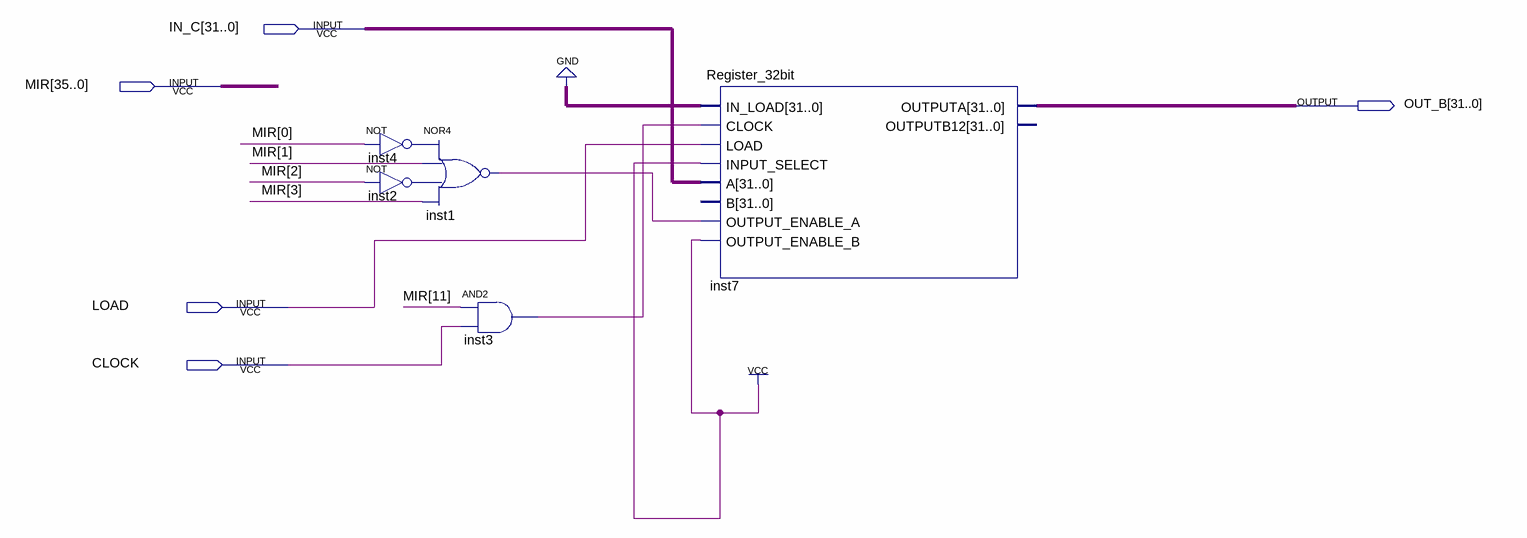
[diagram p0: schematic sheet]
// Quartus schematic LV.bdf as structural Verilog: 5 symbols, 5 pins
module LV (
  input  [31:0] IN_C,
  input  [35:0] MIR,
  input  LOAD,
  input  CLOCK,
  output [31:0] OUT_B
);

  wire inst1_out, inst2_out, inst3_out, inst4_out;

  nor inst1 (inst1_out, inst4_out, MIR[1], inst2_out, MIR[3]);
  not inst4 (inst4_out, MIR[0]);
  not inst2 (inst2_out, MIR[2]);
  and inst3 (inst3_out, MIR[11], CLOCK);
  Register_32bit inst7 (
    .IN_LOAD({32{1'b0}}), .CLOCK(inst3_out), .LOAD(LOAD), .INPUT_SELECT(1'b1), .A(IN_C),
    .OUTPUT_ENABLE_A(inst1_out), .OUTPUT_ENABLE_B(1'b1), .OUTPUTA(OUT_B));  // open: B, OUTPUTB12
endmodule
